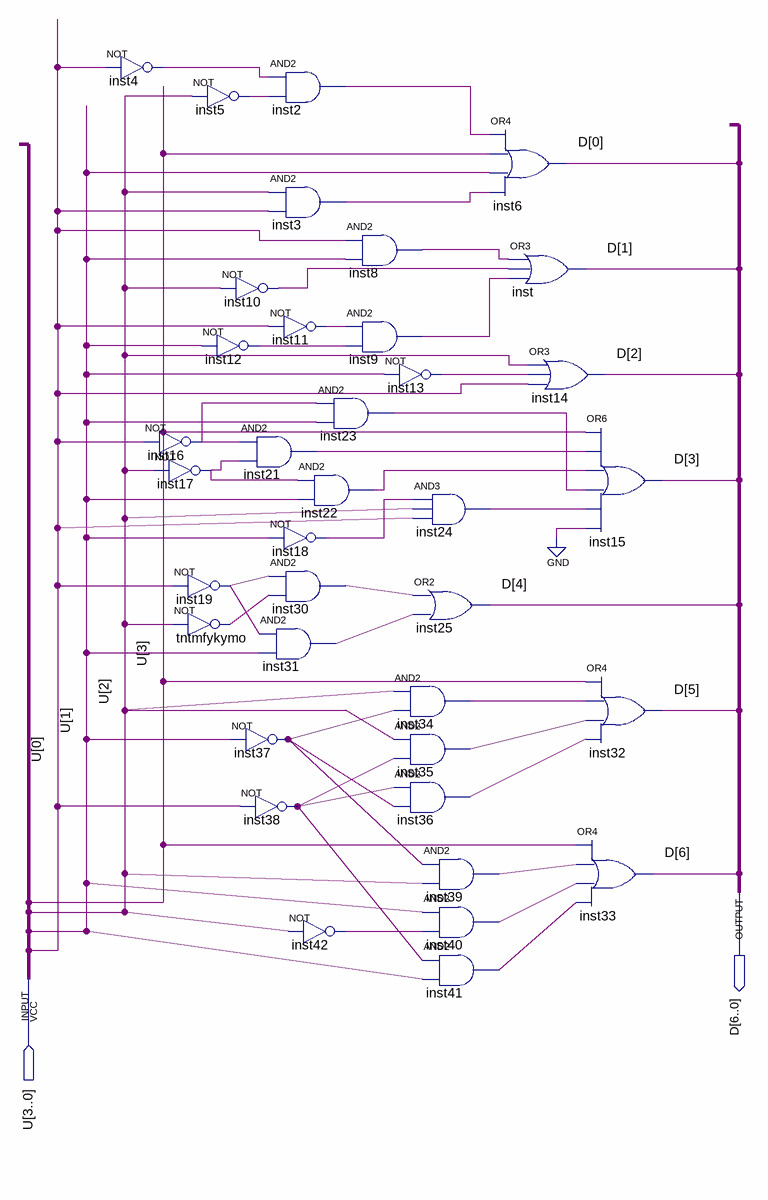
[diagram p0: schematic sheet]
// Quartus schematic DP_UNIDADE.bdf as structural Verilog: 37 symbols, 2 pins
module DP_UNIDADE (
  input  [3:0] U,
  output [6:0] D
);

  wire inst2_out, inst3_out, inst4_out, inst5_out, inst8_out, inst9_out, inst10_out, inst11_out, inst12_out,
       inst13_out, inst16_out, inst17_out, inst18_out, inst19_out, inst21_out, inst22_out, inst23_out,
       inst24_out, inst30_out, inst31_out, inst34_out, inst35_out, inst36_out, inst37_out, inst38_out,
       inst39_out, inst40_out, inst41_out, inst42_out, tntmfykymo_out;

  not inst4 (inst4_out, U[0]);
  not inst16 (inst16_out, U[0]);
  not inst5 (inst5_out, U[2]);
  not inst10 (inst10_out, U[2]);
  not inst12 (inst12_out, U[1]);
  not inst17 (inst17_out, U[2]);
  not inst19 (inst19_out, U[0]);
  not tntmfykymo (tntmfykymo_out, U[2]);
  and inst2 (inst2_out, inst4_out, inst5_out);
  and inst3 (inst3_out, U[2], U[0]);
  not inst11 (inst11_out, U[0]);
  and inst21 (inst21_out, inst16_out, inst17_out);
  and inst22 (inst22_out, inst17_out, U[1]);
  not inst18 (inst18_out, U[1]);
  and inst30 (inst30_out, inst19_out, tntmfykymo_out);
  and inst31 (inst31_out, inst19_out, U[1]);
  not inst37 (inst37_out, U[1]);
  not inst38 (inst38_out, U[0]);
  not inst42 (inst42_out, U[2]);
  and inst8 (inst8_out, U[0], U[1]);
  and inst9 (inst9_out, inst11_out, inst12_out);
  and inst23 (inst23_out, inst16_out, U[1]);
  not inst13 (inst13_out, U[1]);
  and inst24 (inst24_out, inst18_out, U[2], U[0]);
  or inst25 (D[4], inst30_out, inst31_out);
  and inst34 (inst34_out, U[2], inst37_out);
  and inst35 (inst35_out, U[2], inst38_out);
  and inst36 (inst36_out, inst38_out, inst37_out);
  and inst39 (inst39_out, inst37_out, U[2]);
  and inst40 (inst40_out, U[1], inst42_out);
  and inst41 (inst41_out, inst38_out, U[1]);
  or inst6 (D[0], inst2_out, U[3], U[1], inst3_out);
  or inst (D[1], inst8_out, inst10_out, inst9_out);
  or inst14 (D[2], U[2], inst13_out, U[0]);
  or inst15 (D[3], U[3], inst21_out, inst22_out, inst23_out, inst24_out, 1'b0);
  or inst32 (D[5], U[3], inst34_out, inst35_out, inst36_out);
  or inst33 (D[6], U[3], inst39_out, inst40_out, inst41_out);
endmodule
